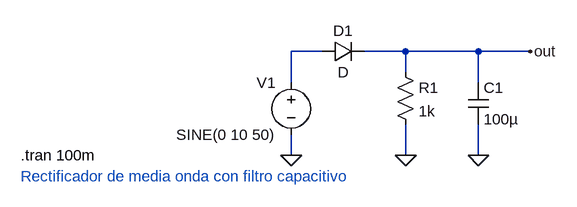
[diagram p0: schematic Half-wave Rectifier.asc]
Half-wave Rectifier.asc, the LTspice schematic file:
Version 4
SHEET 1 880 680
WIRE 0 16 0 -32
WIRE 0 -32 48 -32
WIRE 112 -32 176 -32
WIRE 176 -32 288 -32
WIRE 176 -32 176 0
WIRE 288 -32 368 -32
WIRE 288 -32 288 16
WIRE 0 96 0 128
WIRE 176 128 176 80
WIRE 288 128 288 80
FLAG 368 -32 out
FLAG 0 128 0
FLAG 176 128 0
FLAG 288 128 0
SYMBOL voltage 0 0 M0
WINDOW 0 24 16 Left 2
WINDOW 3 24 96 Left 2
SYMATTR InstName V1
SYMATTR Value SINE(0 10 50)
SYMATTR Prefix V
SYMBOL diode 48 -16 R270
WINDOW 0 32 32 VTop 2
WINDOW 3 0 32 VBottom 2
SYMATTR InstName D1
SYMATTR Value D
SYMATTR Prefix D
SYMBOL res 160 -16 R0
WINDOW 0 36 40 Left 2
WINDOW 3 36 76 Left 2
SYMATTR InstName R1
SYMATTR Value 1k
SYMATTR Prefix R
SYMBOL cap 272 16 R0
WINDOW 0 24 8 Left 2
WINDOW 3 24 56 Left 2
SYMATTR InstName C1
SYMATTR Value 100µ
SYMATTR Prefix C
TEXT -416 128 Left 2 !.tran 100m
TEXT -416 160 Left 2 ;Rectificador de media onda con filtro capacitivo

The netlist it stands for:
* Half-wave Rectifier.asc
V1 N001 0 SINE(0 10 50)
D1 N001 out D
R1 out 0 1k
C1 out 0 100µ
.model D D
.lib standard.dio
.tran 100m
* Rectificador de media onda con filtro capacitivo
.backanno
.end